# Altium schematic sheet Button LED Power.SchDoc
size A; SheetNumber: 6; SheetTotal: 6
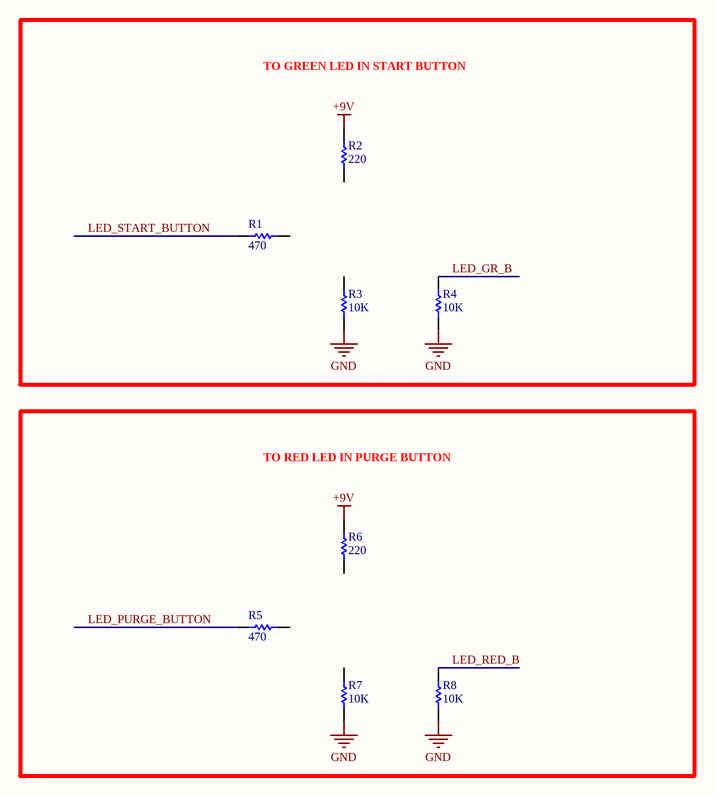
[diagram p0: Button LED Power.SchDoc]

## Parts
R1  470  [RESA60-630X240]
R2  220  [RESA60-630X240]
R3  10K  [RESA60-630X240]
R4  10K  [RESA60-630X240]
R5  470  [RESA60-630X240]
R6  220  [RESA60-630X240]
R7  10K  [RESA60-630X240]
R8  10K  [RESA60-630X240]

## Blocks framed on the sheet
TO GREEN LED IN START BUTTON: R1-R4
TO RED LED IN PURGE BUTTON: R5-R8

## Nets
+9V: R2.2 R6.2
GND: R3.1 R4.1 R7.1 R8.1
LED_GR_B: R4.2
LED_PURGE_BUTTON: R5.1
LED_RED_B: R8.2
LED_START_BUTTON: R1.1

Not connected (* = marked no-connect by the designer): R1 2; R2 1; R3 2; R5 2; R6 1; R7 2

## Library data of the parts
R1-R8 = CMP-1659-00070-1: Axial Resistor, 1 MOhm, +/- 1%, 250 mW, -55 to 155 degC, 2-Pin THD, RoHS, Bulk; Power Rating: 250 mW; Resistance: 47.5 kohm; Voltage Rating: 250 V; ComponentLink1Description: Manufacturer URL; PackageReference: MFR-25; ComponentLink2Description: Datasheet; ComponentLink2URL: http://www.yageo.com/documents/recent/Yageo%20LR_MFR_2013.pdf; Tolerance: 1%; DatasheetVersion: Apr-13; Package Quantity: 200; Packaging: Bulk; Case\Package: Axial; RoHSCompliant: true; ComponentLink1URL: http://www.yageo.com/; Length: 0.248 inch; Min Operating Temperature: -55 degC; Mount: Through Hole; PackageDescription: 2-Pin Axial Lead, Dia 2.4 mm, Body Length 6.3 mm; Max Operating Temperature: 155 degC